# Altium schematic sheet Peripherals.SchDoc
size A; SheetNumber: 3; SheetTotal: 3
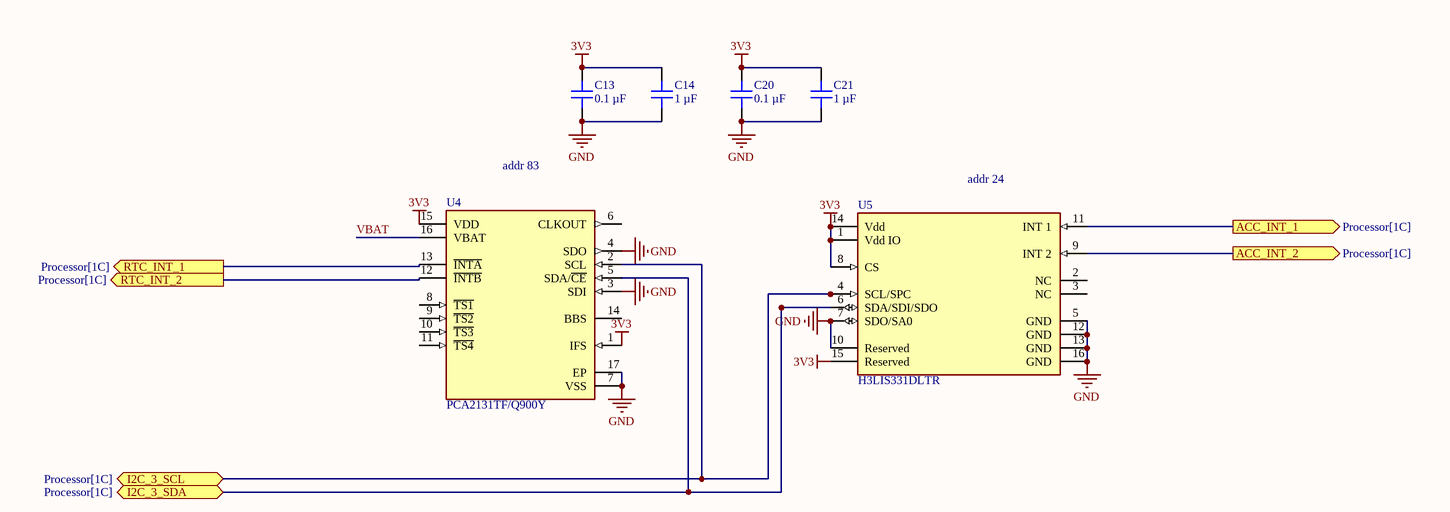
[diagram p0: Peripherals.SchDoc]

## Parts
C13  0.1 µF  [CAP 0402_1005]
C14  1 µF  [CAP 0402_1005]
C20  0.1 µF  [CAP 0402_1005]
C21  1 µF  [CAP 0402_1005]
U4  PCA2131TF/Q900Y  [FP-SOT1992-1_DD-MFG]
U5  H3LIS331DLTR  [FP-TFLGA16-7983231-MFG]

## Ports
ACC_INT_1 (out, see Processor[1C]), ACC_INT_2 (out, see Processor[1C]), I2C_3_SCL (bidir, see Processor[1C]), I2C_3_SDA (bidir, see Processor[1C]), RTC_INT_1 (out, see Processor[1C]), RTC_INT_2 (out, see Processor[1C])

## Nets
3V3: C13.2 C14.2 C20.2 C21.2 U4.1(IFS) U4.15(VDD) U5.1(Vdd_IO) U5.8(CS) U5.14(Vdd) U5.15(Reserved)
GND: C13.1 C14.1 C20.1 C21.1 U4.3(SDI) U4.4(SDO) U4.7(VSS) U4.17(EP) U5.5(GND) U5.7(SDO/SA0) U5.10(Reserved) U5.12(GND) U5.13(GND) U5.16(GND)
ACC_INT_1: U5.11(INT_1) ; port ACC_INT_1
ACC_INT_2: U5.9(INT_2) ; port ACC_INT_2
I2C_3_SCL: U4.2(SCL) U5.4(SCL/SPC) ; port I2C_3_SCL
I2C_3_SDA: U4.5(SDA/~{CE}) U5.6(SDA/SDI/SDO) ; port I2C_3_SDA
RTC_INT_1: U4.13(~{INTA}) ; port RTC_INT_1
RTC_INT_2: U4.12(~{INTB}) ; port RTC_INT_2
VBAT: U4.16(VBAT)

Not connected (* = marked no-connect by the designer): U4 6(CLKOUT) 8(~{TS1}) 9(~{TS2}) 10(~{TS3}) 11(~{TS4}) 14(BBS); U5 2(NC) 3(NC)

## Notes on the sheet
- addr 83
- (near U5) addr 24

## Library data of the parts
C13 C20 = C0402C104K7PAC7867: CAP CER 0.1UF 4V X5R 0402; manufacturer: KEMET; Tolerance: ±10%; Part Number: C0402C104K7PAC7867; Value: 0.1 µF; Applications: Bypass, Decoupling; Capacitance: 0.1 µF; componentlink1description: Datasheet; componentlink1url: https://api.kemet.com/component-edge/download/datasheet/C0402C104K7PAC7867.pdf; componentlink2description: DigiKey Link; componentlink2url: https://www.digikey.com/en/products/detail/kemet/C0402C104K7PAC7867/7381987; Device Package: 0402 (1005 Metric); lastupdated: 11/9/2022 9:36:31 am; Lifecycle Status: Active; Minimum Order: 1; Mounting Type: Surface Mount, MLCC; Operating Temperature: -55°C ~ 85°C; Package / Case: 0402 (1005 Metric); packaging: TapeAndReel; partid: 5603; Part Status: Active; price: 0.01; series: SMD Comm X5R; Size / Dimension: 0.039" L x 0.020" W (1.00mm x 0.50mm); Supplier 1: DigiKey; Supplier Part Number 1: 399-14871-1-ND; Temperature Coefficient: X5R; Thickness (Max): 0.022" (0.55mm); Voltage - Rated: 4V
C14 C21 = LMK105C6105KV-F: CAP CER 1UF 10V X6S 0402; manufacturer: Taiyo Yuden; Tolerance: ±10%; Part Number: LMK105C6105KV-F; Value: 1 µF; Applications: SMPS Filtering; Capacitance: 1 µF; componentlink1description: Datasheet; componentlink1url: https://www.yuden.co.jp/productdata/catalog/mlcc01_e.pdf; componentlink2description: DigiKey Link; componentlink2url: https://www.digikey.com/en/products/detail/taiyo-yuden/LMK105C6105KV-F/4157226; Device Package: 0402 (1005 Metric); lastupdated: 11/9/2022 9:36:40 am; Lifecycle Status: Active; Minimum Order: 1; Mounting Type: Surface Mount, MLCC; Operating Temperature: -55°C ~ 105°C; Package / Case: 0402 (1005 Metric); packaging: TapeAndReel; partid: 2215; Part Status: Active; price: 0.01; series: M; Size / Dimension: 0.039" L x 0.020" W (1.00mm x 0.50mm); Supplier 1: DigiKey; Supplier Part Number 1: 587-3409-1-ND; Temperature Coefficient: X6S; Thickness (Max): 0.022" (0.55mm); Voltage - Rated: 10V
U4 = CMP-10083-000021-1: IC RTC W/XTAL AUTO HLSON16
U5 = CMP-12175-000002-1: ACCEL 100-400G I2C/SPI 16TFLGA; Manufacturer: STMicroelectronics; Min Supply Voltage: 2.16V; Accel Axis: X+Y and Z; Sensor Output: I2C,SPI; Accel Resolution: 16bits; Operating Supply Current: 10-300uA; Accel Range: 100/200/400g; Max Supply Voltage: 3.6V; Temperature: -40°C to +85°C; Octopart: https://octopart.com/h3lis331dltr-stmicroelectronics-29186499; Automotive: No; Digikey Description: ACCEL 100-400G I2C/SPI 16TFLGA; Device Class L3: Accelerometers; ComponentLink2URL: https://www.st.com/resource/en/datasheet/h3lis331dl.pdf; Device Class L2: Motion Sensors; Package: TFLGA16-7983231; Mouser Description: Accelerometer Triple +/-100g/+/-200g/+/-400g 2.5V 16-Pin TFLGA T/R; ComponentLink2Description: Datasheet; Device Class L1: Sensors; Lead Free: Yes; RoHS: TRUE; Footprint Url: https://www.st.com/content/ccc/resource/technical/document/technical_note/73/17/9c/16/dd/96/4a/01/CD00134799.pdf/files/CD00134799.pdf/jcr:content/translations/en.CD00134799.pdf; Height: 1mm; Category: IC; Manufacturer Part Number: H3LIS331DLTR; Temperature Range Low: -40°C; Temperature Range High: +85°C